# Altium schematic sheet Root.SchDoc: Business Idea PCB Root
size Tabloid; Author: Adam Turaj; SheetNumber: 1; SheetTotal: 6
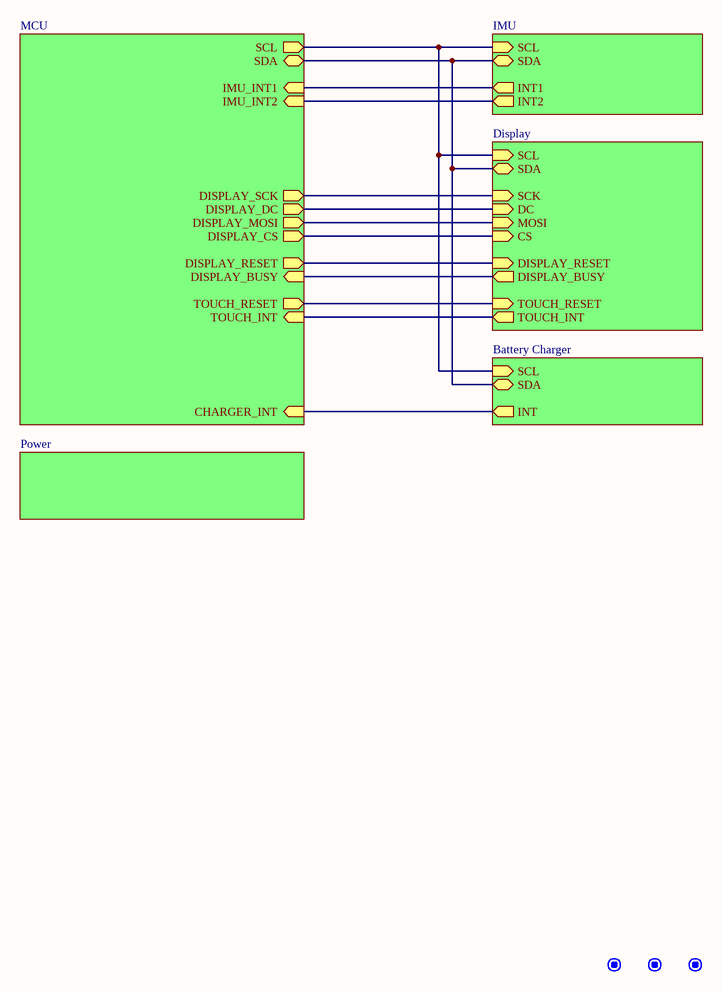
[diagram p0: Root.SchDoc]

## Parts
FD1  FID1X2R  [FID1X2R]  (value not drawn)  (no BOM)
FD2  FID1X2R  [FID1X2R]  (value not drawn)  (no BOM)
FD3  FID1X2R  [FID1X2R]  (value not drawn)  (no BOM)

## Sub-sheets
Battery Charger = Battery_Charger.SchDoc: SDA (bidir), SCL (in), INT (out)
Display = Display.SchDoc: SCL (in), SDA (bidir), SCK (in), DC (in), CS (in), MOSI (in), DISPLAY_BUSY (out), DISPLAY_RESET (in), TOUCH_INT (out), TOUCH_RESET (in)
IMU = IMU.SchDoc: INT2 (out), INT1 (out), SDA (bidir), SCL (in)
MCU = MCU.SchDoc: SCL (out), SDA (bidir), IMU_INT2 (in), IMU_INT1 (in), CHARGER_INT (in), TOUCH_INT (in), TOUCH_RESET (out), DISPLAY_BUSY (in), DISPLAY_RESET (out), DISPLAY_CS (out), DISPLAY_MOSI (out), DISPLAY_DC (out), DISPLAY_SCK (out)
Power = Power.SchDoc: no entries

## Nets
(unnamed): sheet MCU/SCL, sheet IMU/SCL, sheet Display/SCL, sheet Battery Charger/SCL
(unnamed): sheet MCU/SDA, sheet IMU/SDA, sheet Display/SDA, sheet Battery Charger/SDA
(unnamed): sheet MCU/IMU_INT2, sheet IMU/INT2
(unnamed): sheet MCU/IMU_INT1, sheet IMU/INT1
(unnamed): sheet MCU/CHARGER_INT, sheet Battery Charger/INT
(unnamed): sheet MCU/TOUCH_INT, sheet Display/TOUCH_INT
(unnamed): sheet MCU/TOUCH_RESET, sheet Display/TOUCH_RESET
(unnamed): sheet MCU/DISPLAY_BUSY, sheet Display/DISPLAY_BUSY
(unnamed): sheet MCU/DISPLAY_RESET, sheet Display/DISPLAY_RESET
(unnamed): sheet MCU/DISPLAY_CS, sheet Display/CS
(unnamed): sheet MCU/DISPLAY_MOSI, sheet Display/MOSI
(unnamed): sheet MCU/DISPLAY_DC, sheet Display/DC
(unnamed): sheet MCU/DISPLAY_SCK, sheet Display/SCK

## Notes on the sheet
- Title:
- Author:
- Size:
- Date:
- Git Hash:
- Tabloid
- Prj:
- Variant:
- Edited:
- File:

## Library data of the parts
FD1-FD3 = CMP-00028-00005-2: Fiducial - Round 1x2mm; Pins: 0